# EasyEDA Pro project ProPrj_H750VBT6M2_2025-05-30.epro, schematic Base
Board Name: Board2; Create Date: 2025-05-18; Page Name: P1; Project Name: H750VBT6M2; Schematic Name: Base; Update Date: 2025-05-20; Company: 嘉立创EDA; Page Size: A4; Version: V1.0
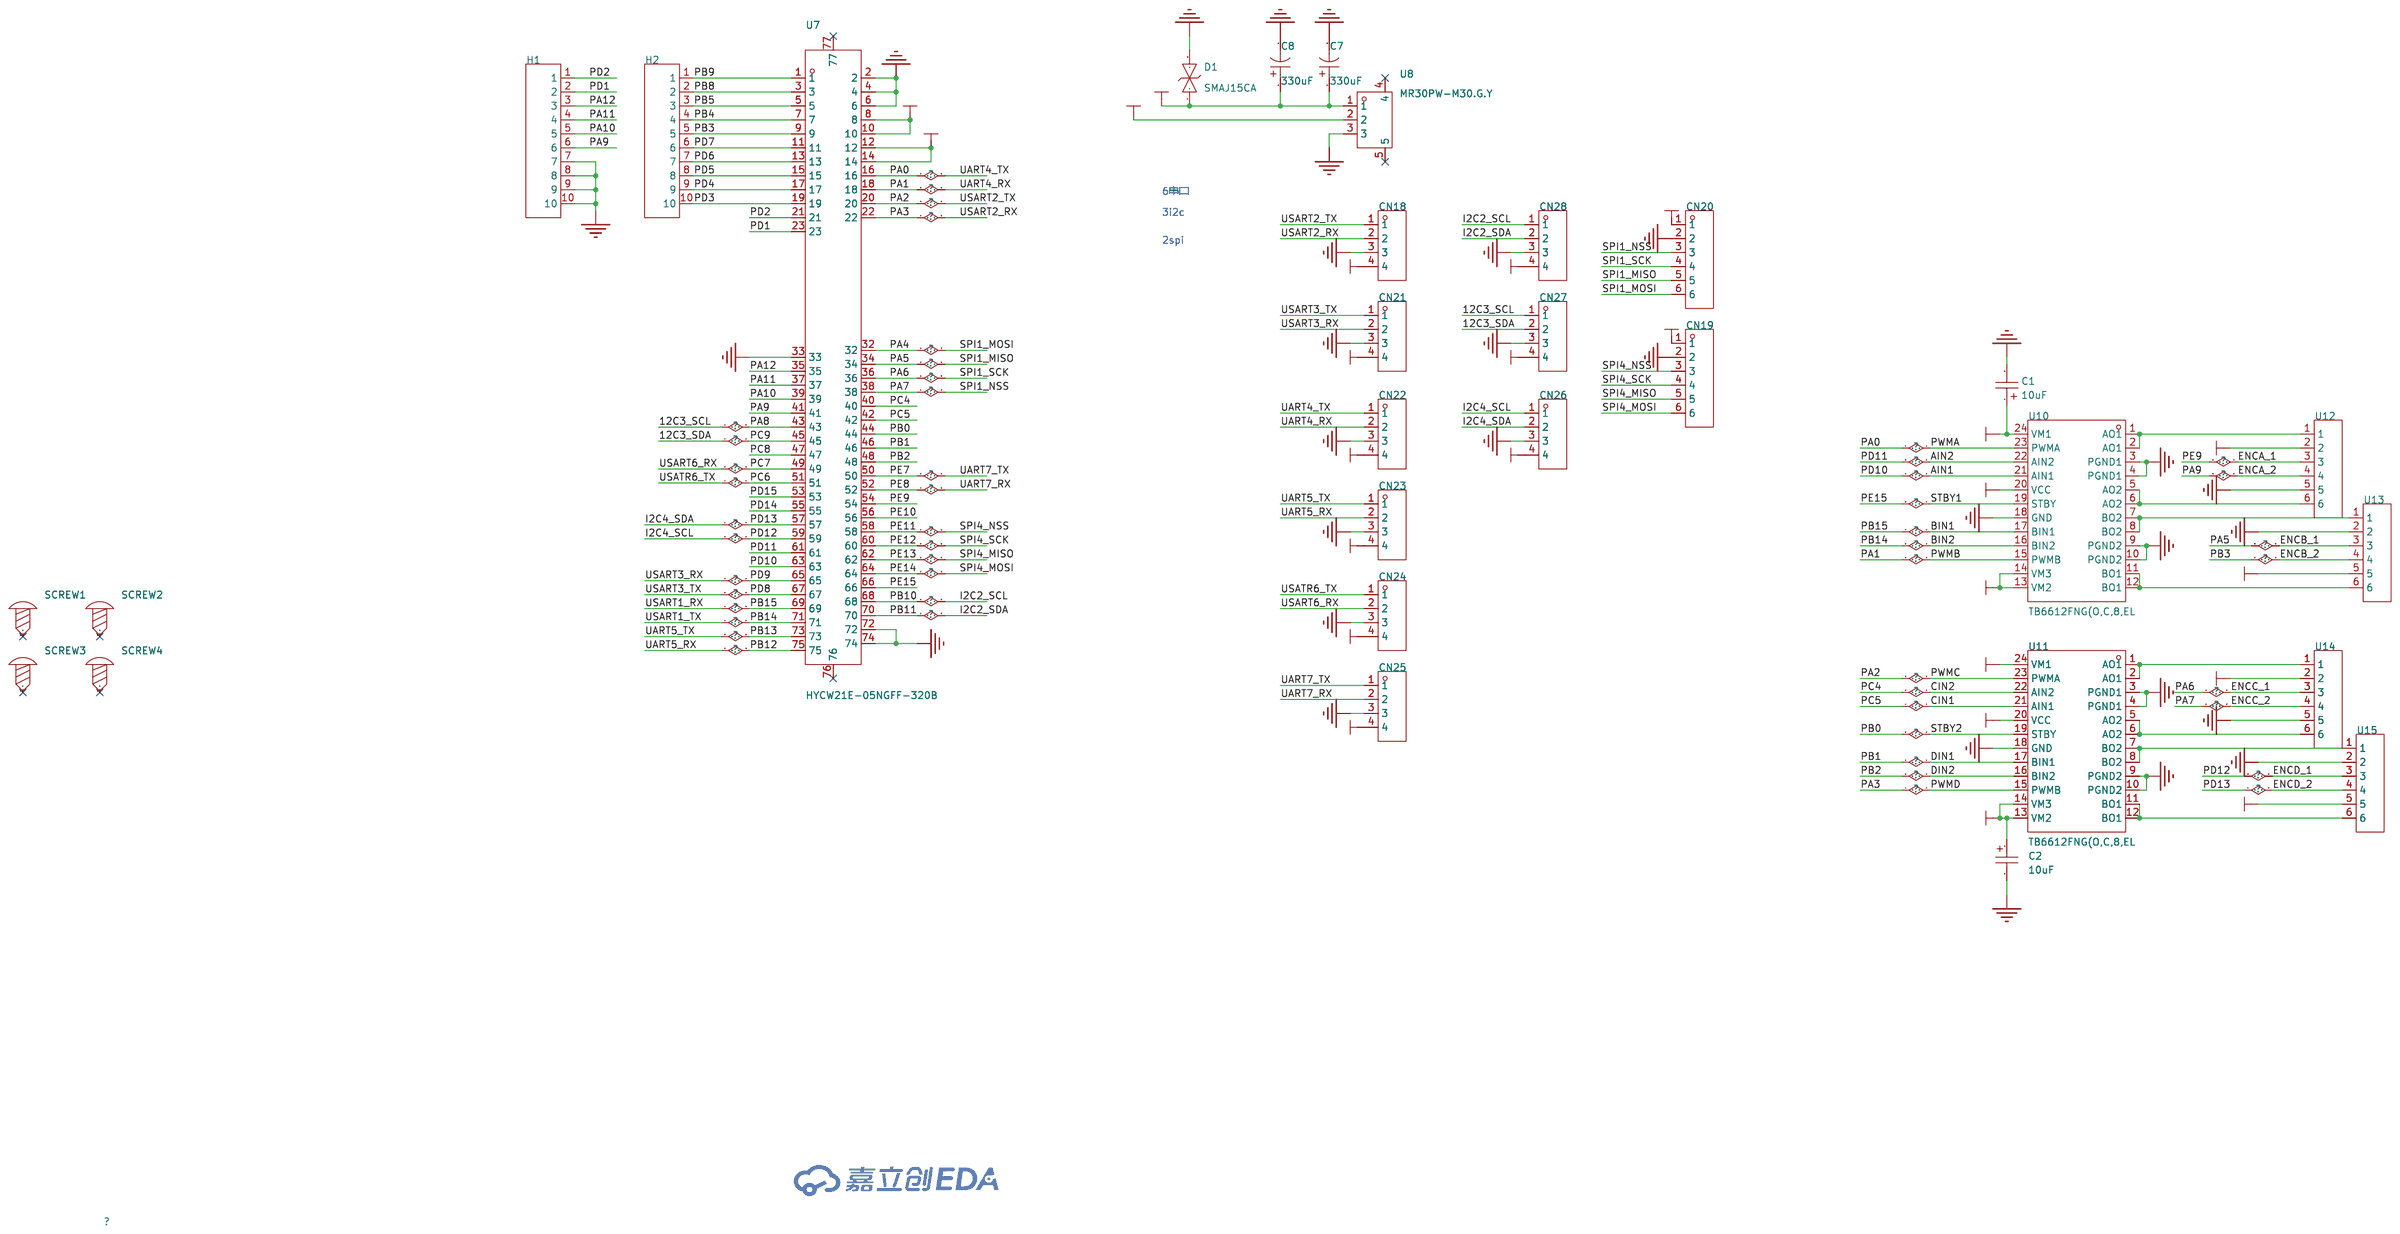
[diagram p0: schematic sheet]

## Parts
C1  10uF  [CAP-SMD_L3.2-W1.6-RD-C7171]
C2  10uF  [CAP-SMD_L3.2-W1.6-RD-C7171]
C7  330uF  [CAP-SMD_BD6.3-L6.6-W6.6-FD]
C8  330uF  [CAP-SMD_BD6.3-L6.6-W6.6-FD]
CN18  WAFER-XH254Z-4A  [CONN-TH_XH-4A]
CN19  WAFER-XH254Z-6A  [CONN-TH_XH2.54-6P]
CN20  WAFER-XH254Z-6A  [CONN-TH_XH2.54-6P]
CN21  WAFER-XH254Z-4A  [CONN-TH_XH-4A]
CN22  WAFER-XH254Z-4A  [CONN-TH_XH-4A]
CN23  WAFER-XH254Z-4A  [CONN-TH_XH-4A]
CN24  WAFER-XH254Z-4A  [CONN-TH_XH-4A]
CN25  WAFER-XH254Z-4A  [CONN-TH_XH-4A]
CN26  WAFER-XH254Z-4A  [CONN-TH_XH-4A]
CN27  WAFER-XH254Z-4A  [CONN-TH_XH-4A]
CN28  WAFER-XH254Z-4A  [CONN-TH_XH-4A]
D1  SMAJ15CA  [SMA_L4.3-W2.6-LS5.0-BI]
H1  -  [HDR-TH_10P-P2.54-V-M-1]
H2  -  [HDR-TH_10P-P2.54-V-M-1]
SCREW1  -  [M3螺丝]
SCREW2  -  [M3螺丝]
SCREW3  -  [M3螺丝]
SCREW4  -  [M3螺丝]
U7  HYCW21E-05NGFF-320B  [CONN-SMD_HYCW21E-05NGFF-320B]
U8  MR30PW-M30.G.Y  [CONN-TH_MR30PW-M30-G-Y]
U10  TB6612FNG(O,C,8,EL  [SSOP-24_L8.4-W5.8-P0.65-LS7.8-BL]
U11  TB6612FNG(O,C,8,EL  [SSOP-24_L8.4-W5.8-P0.65-LS7.8-BL]
U12  WAFER-XH254WZ-6A  [CONN-TH_6P-P2.50_WAFER-XH254WZ-6A]
U13  WAFER-XH254WZ-6A  [CONN-TH_6P-P2.50_WAFER-XH254WZ-6A]
U14  WAFER-XH254WZ-6A  [CONN-TH_6P-P2.50_WAFER-XH254WZ-6A]
U15  WAFER-XH254WZ-6A  [CONN-TH_6P-P2.50_WAFER-XH254WZ-6A]

## Library data of the parts
C1 C2 = TAJA106K016RNJ: 容值:10uF;精度:±10%;额定电压:16V;等效串联电阻(ESR):3Ω@100kHz;; LCSC Part Name: 10uF ±10% 16V; Supplier Part: C7171; Manufacturer: Kyocera AVX; Supplier Footprint: CASE-A-3216-18(mm); JLCPCB Part Class: Basic Part; Supplier: LCSC; Tolerance: ±10%; Voltage Rating: 16V; Equivalent Series Resistance(ESR): 3Ω@100kHz; Operating Temperature: -55℃~+125℃
C7 C8 = SVZ1EM221E09E00RAXXX: 容值:220uF;精度:±20%;额定电压:25V;纹波电流:-;等效串联电阻(ESR):-;类型:聚合物;; LCSC Part Name: 220uF ±20% 25V; Supplier Part: C2939796; Manufacturer: AISHI(艾华集团); Supplier Footprint: SMD,D6.3xL9mm; JLCPCB Part Class: 扩展库; Datasheet: https://atta.szlcsc.com/upload/public/pdf/source/20220111/A7F51B4B57636E51FA8F936B9D146736.pdf; Supplier: LCSC; Tolerance: ±20%; Voltage Rating: 25V; Type: 聚合物; Diameter: 6.3mm; Height - Seated (Max): 9mm; Operating Temperature: -55℃~+105℃
CN18 CN21-CN28 = WAFER-XH254Z-4A: 插针结构:1x4P;间距:2.54mm;安装方式:直插;参考系列:XH;总PIN数:4P;排数:1;每排PIN数:4;额定电流:3A;触头材质:黄铜;工作温度:-25℃~+85℃;; LCSC Part Name: 1x4P 间距:2.54mm 直插 系列:XH; Supplier Part: C7432684; Manufacturer: HANBO(汉博); Supplier Footprint: 插件,P=2.5mm; JLCPCB Part Class: 扩展库; Datasheet: https://atta.szlcsc.com/upload/public/pdf/source/20230718/3B4FABA5D38EFB02DAF74E7C2B33D98F.pdf; Supplier: LCSC; Pins Structure: 1x4P; Pitch: 2.54mm; Mounting Type: 直插; Reference Series: XH; Number of Pins: 4P; Number of Rows: 1; Number of PINs Per Row: 4; Current Rating: 3A; Contact Material: 黄铜; Operating Temperature: -25℃~+85℃; Voltage Rating: 250V; Plastic Material: PA66; Flame Retardant Rating: UL94V-0
CN19 CN20 = WAFER-XH254Z-6A: 插针结构:1x6P;间距:2.54mm;安装方式:直插;参考系列:XH;总PIN数:6P;排数:1;每排PIN数:6;额定电流:3A;触头材质:黄铜;工作温度:-25℃~+85℃;; LCSC Part Name: 1x6P 间距:2.54mm 直插 系列:XH; Supplier Part: C7432686; Manufacturer: HANBO(汉博); Supplier Footprint: 插件,P=2.5mm; JLCPCB Part Class: 扩展库; Datasheet: https://atta.szlcsc.com/upload/public/pdf/source/20230718/3B4FABA5D38EFB02DAF74E7C2B33D98F.pdf; Supplier: LCSC; Pins Structure: 1x6P; Pitch: 2.54mm; Mounting Type: 直插; Reference Series: XH; Number of Pins: 6P; Number of Rows: 1; Number of PINs Per Row: 6; Current Rating: 3A; Contact Material: 黄铜; Operating Temperature: -25℃~+85℃; Voltage Rating: 250V; Plastic Material: PA66; Flame Retardant Rating: UL94V-0
D1 = SMAJ15CA_C19077536: 极性:双向;反向截止电压(Vrwm):15V;钳位电压:24.4V;峰值脉冲电流(Ipp):16.4A;峰值脉冲功率(Ppp):400W;击穿电压:16.7V;; Supplier Part: C19077536; Manufacturer: 宏嘉诚; Supplier Footprint: SMA; JLCPCB Part Class: 扩展库; Datasheet: https://atta.szlcsc.com/upload/public/pdf/source/20250107/539D2DC1EE5F9F3FCEFE35DA61E92AD9.pdf; Supplier: LCSC; Polarity: 双向; Reverse Stand-Off Voltage (Vrwm): 15V; Clamping Voltage: 24.4V; Peak Pulse Current (Ipp): 16.4A; Peak Pulse Power Dissipation (Ppp): 400W; Voltage - Breakdown: 16.7V; Reverse Leakage Current (Ir): 1uA; Number of Channels: 单路; Type: TVS
H1 H2 = HDR-M_2.54_1x10P: Supplier Part: C57369; Supplier Footprint: 插件
SCREW1-SCREW4 = M3螺丝: Supplier Footprint: 插件
U7 = HYCW21E-05NGFF-320B: NGFF M.2 E KEY 3.2H  0.5PH; LCSC Part Name: NGFF M.2 E KEY 3.2H 0.5PH; Supplier Part: C41430841; Manufacturer: 华宇创; Supplier Footprint: SMD; JLCPCB Part Class: 扩展库; Datasheet: https://atta.szlcsc.com/upload/public/pdf/source/20241015/5A8FA9A3A5763EF4882F482B7BB79E17.pdf; Supplier: LCSC; Interface Form: M.2-E Key; Connector Type: 母; Number of Pins: 67P; Mounting Type: 卧贴; Height Above Board: 3mm; Supplementary Features: 带柱
U8 = MR30PW-M30.G.Y: LCSC Part Name: MR30PW20三芯PCB 弯插公金黄H=3mm; Supplier Part: C19268036; Manufacturer: AMASS(艾迈斯); JLCPCB Part Class: Extended Part; Datasheet: https://atta.szlcsc.com/upload/public/pdf/source/20231221/E63D24EDC016665263C6304FABBAAC61.pdf; Supplier: LCSC
U10 U11 = TB6612FNG(O,C,8,EL: 双直流电机驱动器集成电路; Supplier Part: C88224; Manufacturer: TOSHIBA(东芝); Supplier Footprint: SSOP-24-208mil; JLCPCB Part Class: 扩展库; Datasheet: https://atta.szlcsc.com/upload/public/pdf/source/20171128/C141517_15118625624231147036.pdf; Supplier: LCSC; RDS(on): 500mΩ; Peak Current: 3.2A; Operating Temperature: -20℃~+85℃
U12-U15 = WAFER-XH254WZ-6A: 插针结构:1x6P;间距:2.54mm;安装方式:弯插;参考系列:XH;总PIN数:6P;排数:1;每排PIN数:6;额定电流:3A;触头材质:黄铜;工作温度:-25℃~+85℃;; LCSC Part Name: 1x6P 间距:2.54mm 弯插 系列:XH; Supplier Part: C7432695; Manufacturer: HANBO(汉博); Supplier Footprint: 插件,P=2.5mm; JLCPCB Part Class: 扩展库; Datasheet: https://atta.szlcsc.com/upload/public/pdf/source/20230721/127D646758C1D4B76FEF9901992220E1.pdf; Supplier: LCSC; Pins Structure: 1x6P; Pitch: 2.54mm; Mounting Type: 弯插; Reference Series: XH; Number of Pins: 6P; Number of Rows: 1; Number of PINs Per Row: 6; Current Rating: 3A; Contact Material: 黄铜; Operating Temperature: -25℃~+85℃; Voltage Rating: 250V; Plastic Material: PA66; Flame Retardant Rating: UL94V-0

## Nets
3V3: U7.12 U7.14
5V: CN18.4 CN19.1 CN20.1 CN21.4 CN22.4 CN23.4 CN24.4 CN25.4 CN26.4 CN27.4 CN28.4 U7.8 U7.10 U8.2 U10.20(VCC) U11.20(VCC) U12.2 U13.5 U14.2 U15.5
12V: C1.1 C2.1 C7.1 C8.1 D1.1 U8.1 U10.13(VM2) U10.14(VM3) U10.24(VM1) U11.13(VM2) U11.14(VM3) U11.24(VM1)
GND: C1.2 C2.2 C7.2 C8.2 CN18.3 CN19.2 CN20.2 CN21.3 CN22.3 CN23.3 CN24.3 CN25.3 CN26.3 CN27.3 CN28.3 D1.2 H1.7 H1.8 H1.9 H1.10 U7.2 U7.4 U7.6 U7.33 U7.72 U7.74 U8.3 U10.3(PGND1) U10.4(PGND1) U10.9(PGND2) U10.10(PGND2) U10.18(GND) U11.3(PGND1) U11.4(PGND1) U11.9(PGND2) U11.10(PGND2) U11.18(GND) U12.5 U13.2 U14.5 U15.2
12C3_SCL: CN27.1 U7.43
12C3_SDA: CN27.2 U7.45
AIN1: U7.63 U10.21(AIN1)
AIN2: U7.61 U10.22(AIN2)
BIN1: U7.69 U10.17(BIN1)
BIN2: U7.71 U10.16(BIN2)
CIN1: U7.42 U11.21(AIN1)
CIN2: U7.40 U11.22(AIN2)
DIN1: U7.46 U11.17(BIN1)
DIN2: U7.48 U11.16(BIN2)
ENCA_1: U7.54 U12.3
ENCA_2: H1.6 U7.41 U12.4
ENCB_1: CN20.5 U7.34 U13.3
ENCB_2: H2.5 U7.9 U13.4
ENCC_1: CN20.4 U7.36 U14.3
ENCC_2: CN20.3 U7.38 U14.4
ENCD_1: CN26.1 U7.59 U15.3
ENCD_2: CN26.2 U7.57 U15.4
I2C2_SCL: CN28.1 U7.68
I2C2_SDA: CN28.2 U7.70
PA0: CN22.1 U7.16 U10.23(PWMA)
PA1: CN22.2 U7.18 U10.15(PWMB)
PA2: CN18.1 U7.20 U11.23(PWMA)
PA3: CN18.2 U7.22 U11.15(PWMB)
PA4: CN20.6 U7.32
PA10: H1.5 U7.39
PA11: H1.4 U7.37
PA12: H1.3 U7.35
PB0: U7.44 U11.19(STBY)
PB4: H2.4 U7.7
PB5: H2.3 U7.5
PB8: H2.2 U7.3
PB9: H2.1 U7.1
PB12: CN23.2 U7.75
PB13: CN23.1 U7.73
PC6: CN24.1 U7.51
PC7: CN24.2 U7.49
PC8: U7.47
PD1: H1.2 U7.23
PD2: H1.1 U7.21
PD3: H2.10 U7.19
PD4: H2.9 U7.17
PD5: H2.8 U7.15
PD6: H2.7 U7.13
PD7: H2.6 U7.11
PD8: CN21.1 U7.67
PD9: CN21.2 U7.65
PD14: U7.55
PD15: U7.53
PE7: CN25.1 U7.50
PE8: CN25.2 U7.52
PE10: U7.56
PE11: CN19.3 U7.58
PE12: CN19.4 U7.60
PE13: CN19.5 U7.62
PE14: CN19.6 U7.64
PE15: U7.66 U10.19(STBY)
$1N1888: U10.1(AO1) U10.2(AO1) U12.1
$1N1903: U10.5(AO2) U10.6(AO2) U12.6
$1N1916: U10.11(BO1) U10.12(BO1) U13.6
$1N1922: U10.7(BO2) U10.8(BO2) U13.1
$1N2388: U11.11(BO1) U11.12(BO1) U15.6
$1N2391: U11.5(AO2) U11.6(AO2) U14.6
$1N2394: U11.7(BO2) U11.8(BO2) U15.1
$1N2421: U11.1(AO1) U11.2(AO1) U14.1

Not connected (* = marked no-connect by the designer): SCREW1 1*; SCREW2 1*; SCREW3 1*; SCREW4 1*; U7 76* 77*; U8 4* 5*

## Notes on the sheet
- 6串口
- 3i2c
- 2spi
